# Altium project Main_board2.PrjPcb
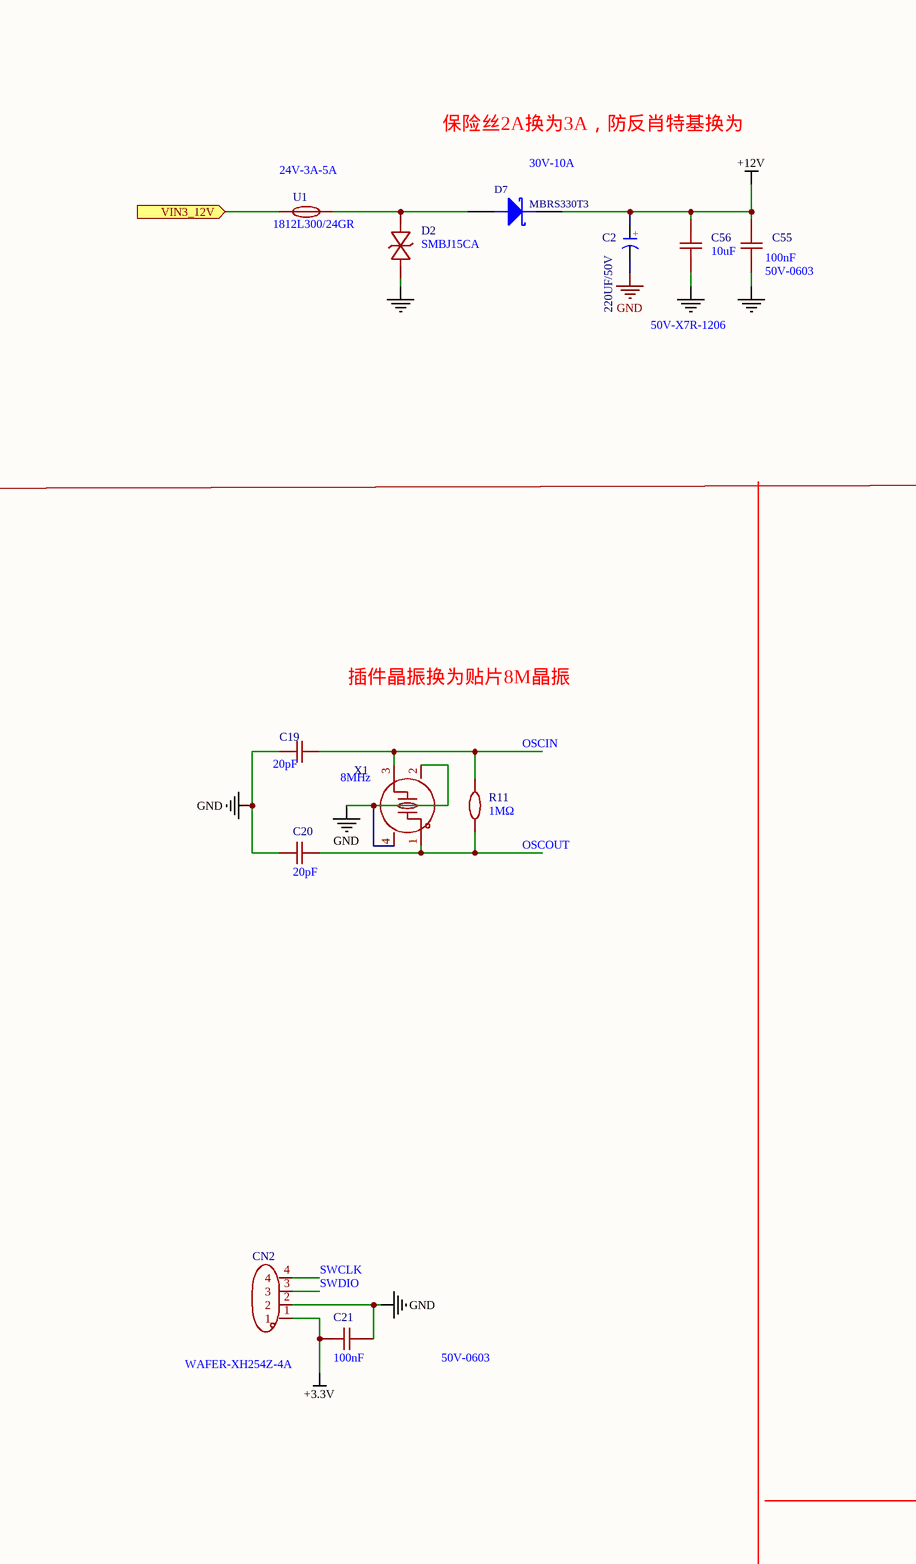
[diagram p0: heater_V1.schdoc, top left]
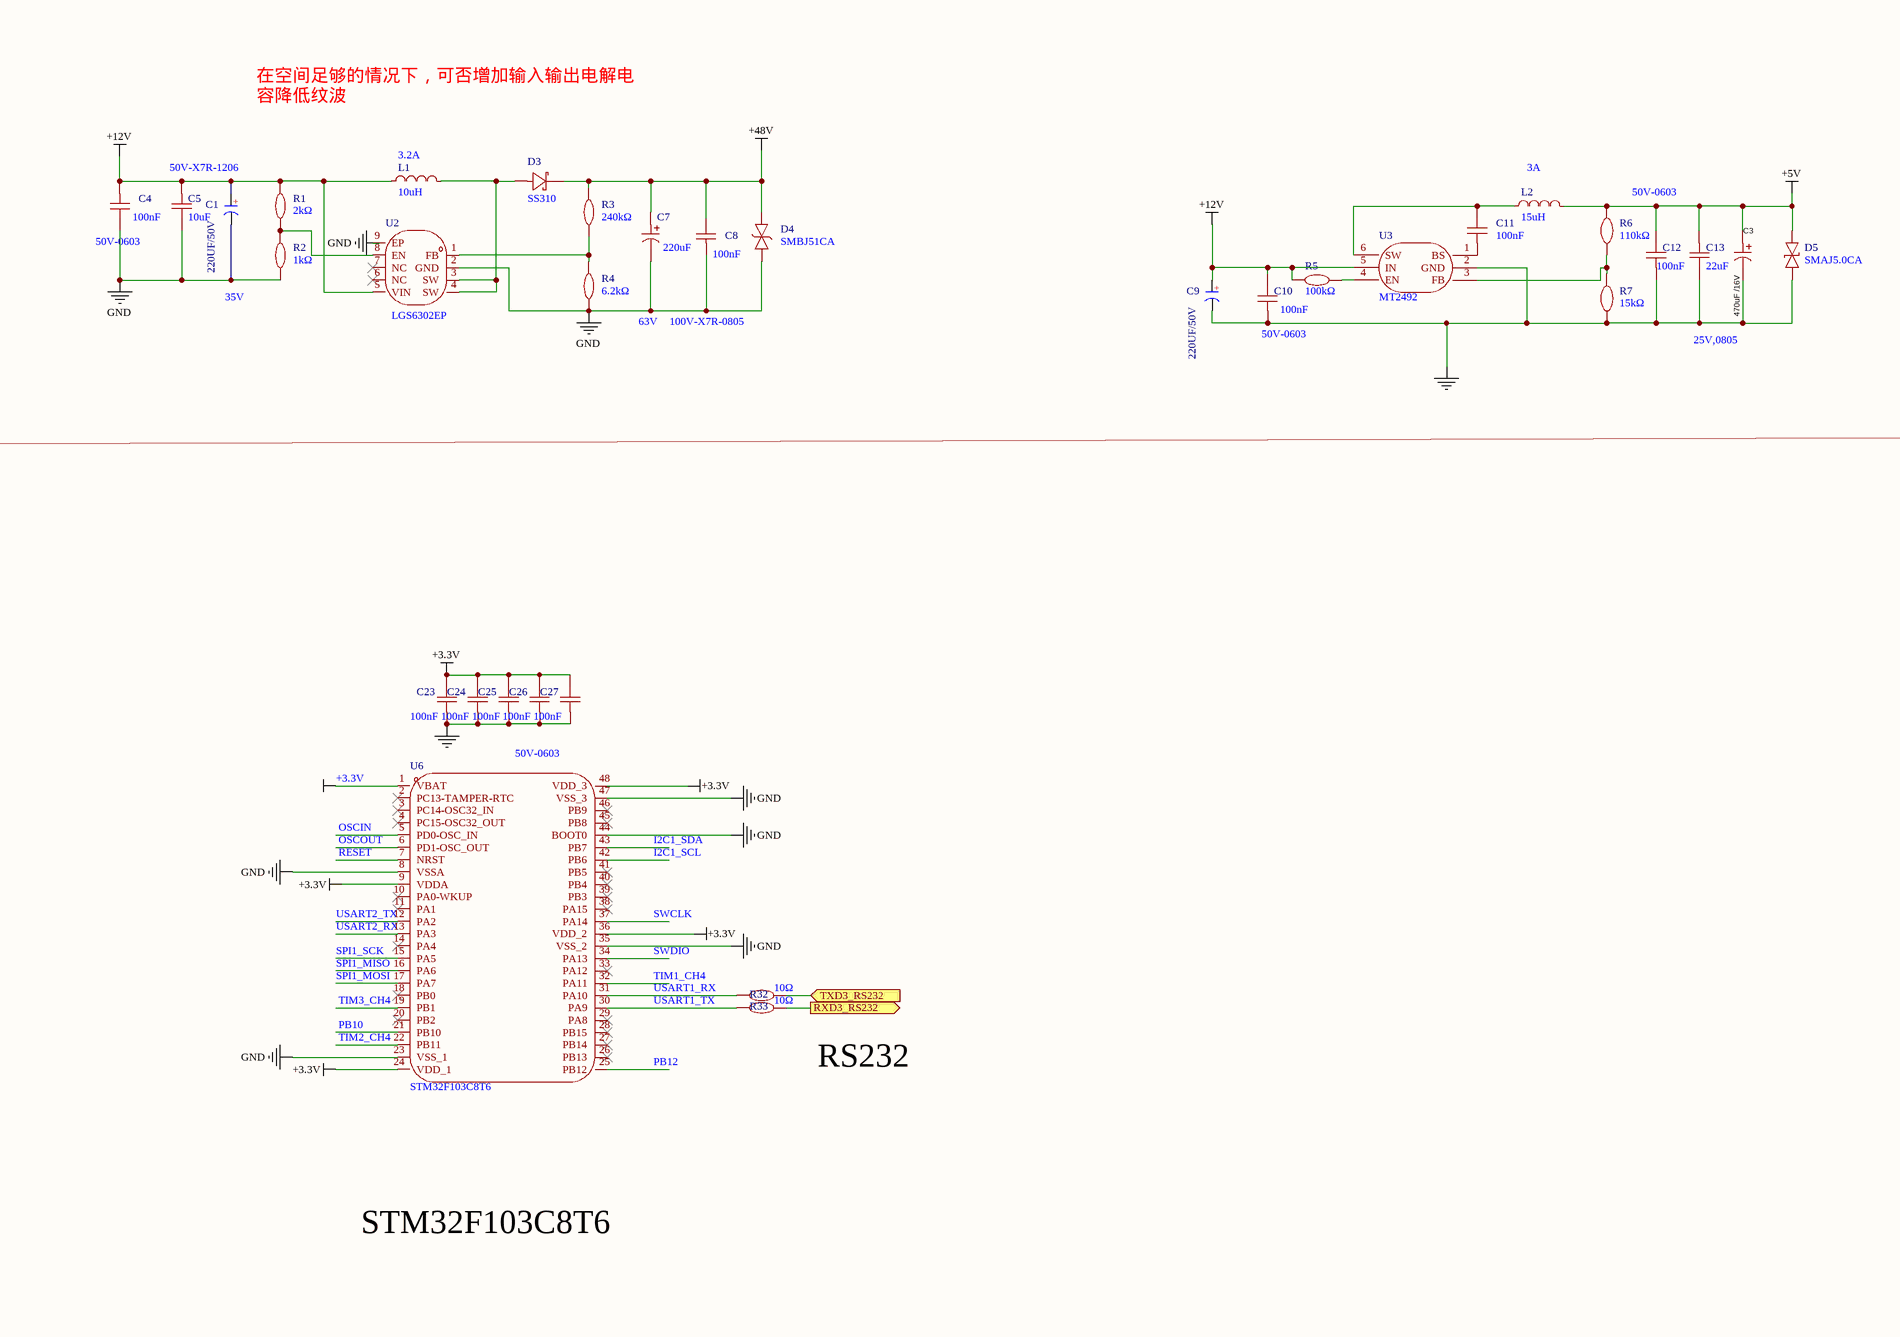
[diagram p1: heater_V1.schdoc, top middle]
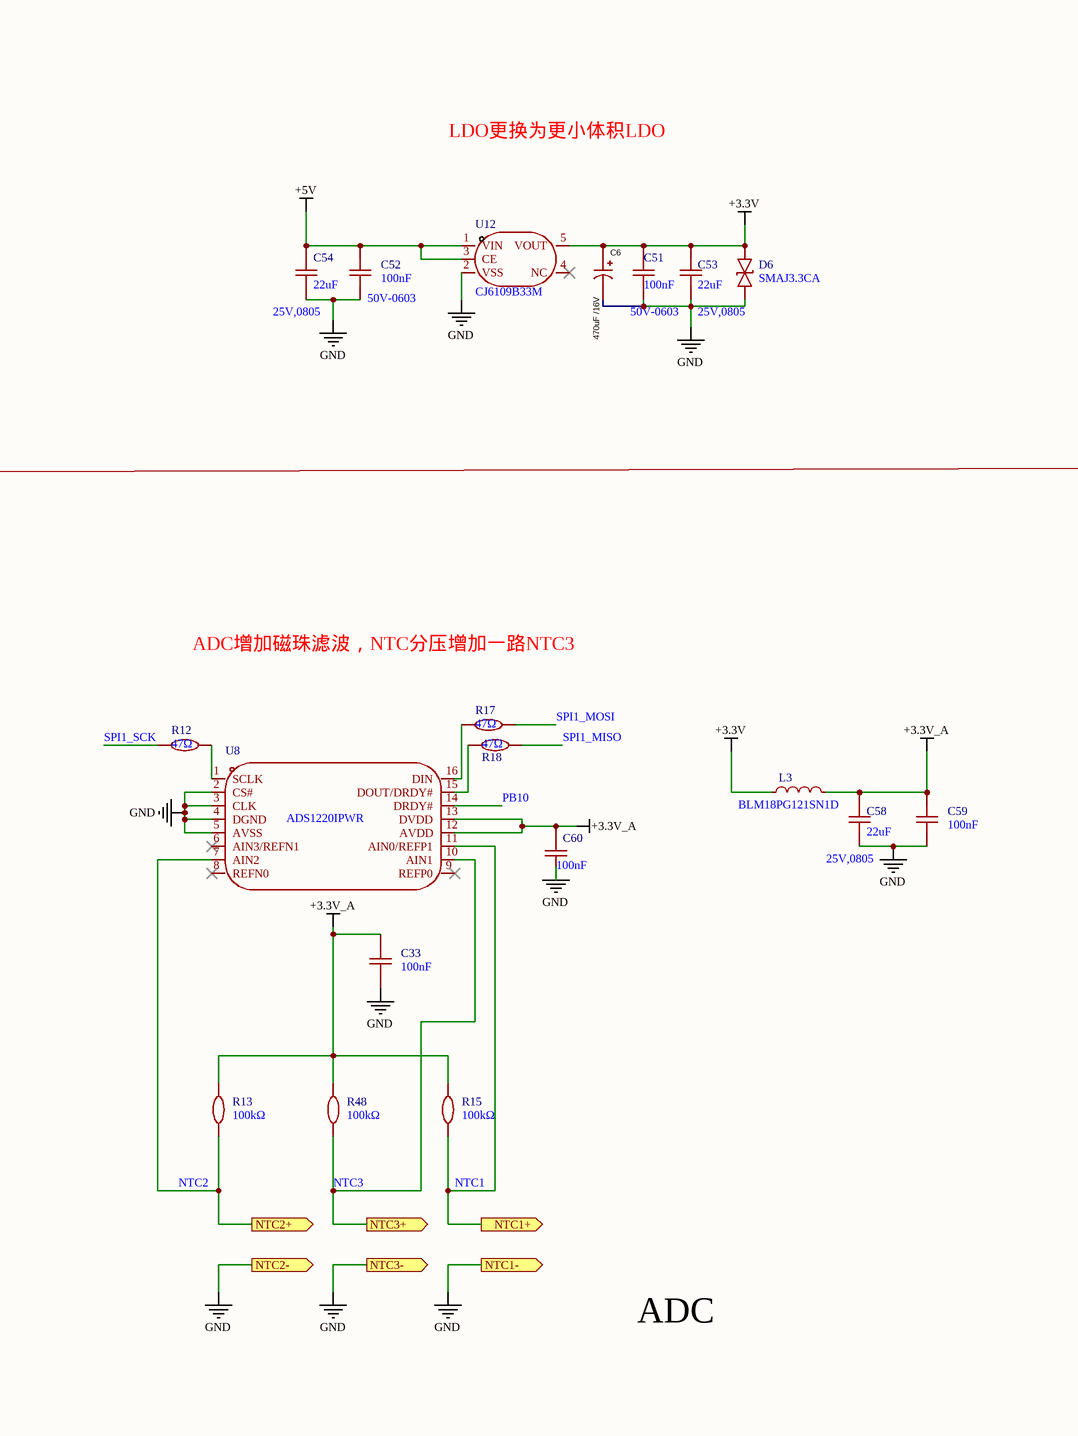
[diagram p2: heater_V1.schdoc, top right]
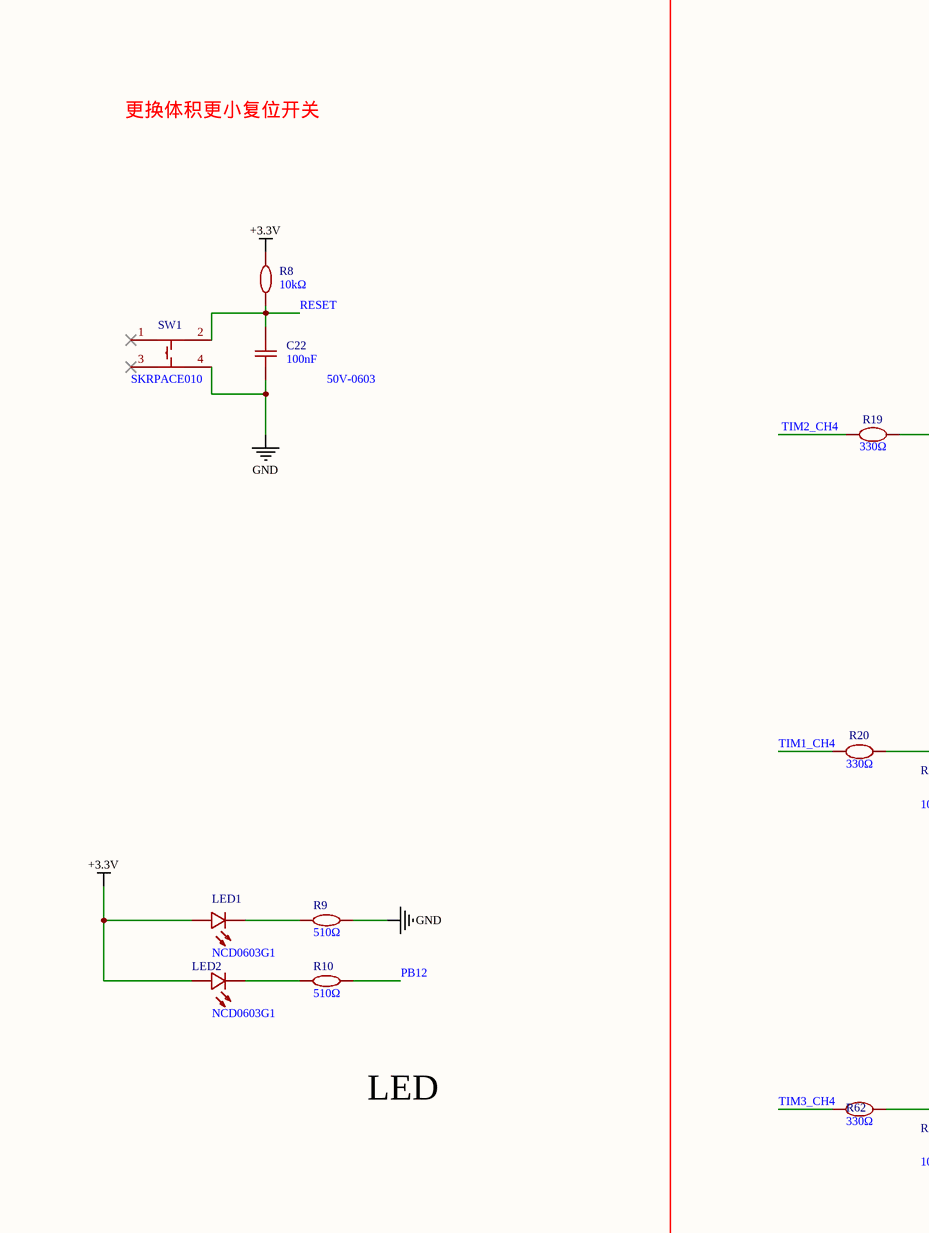
[diagram p3: heater_V1.schdoc, bottom left]
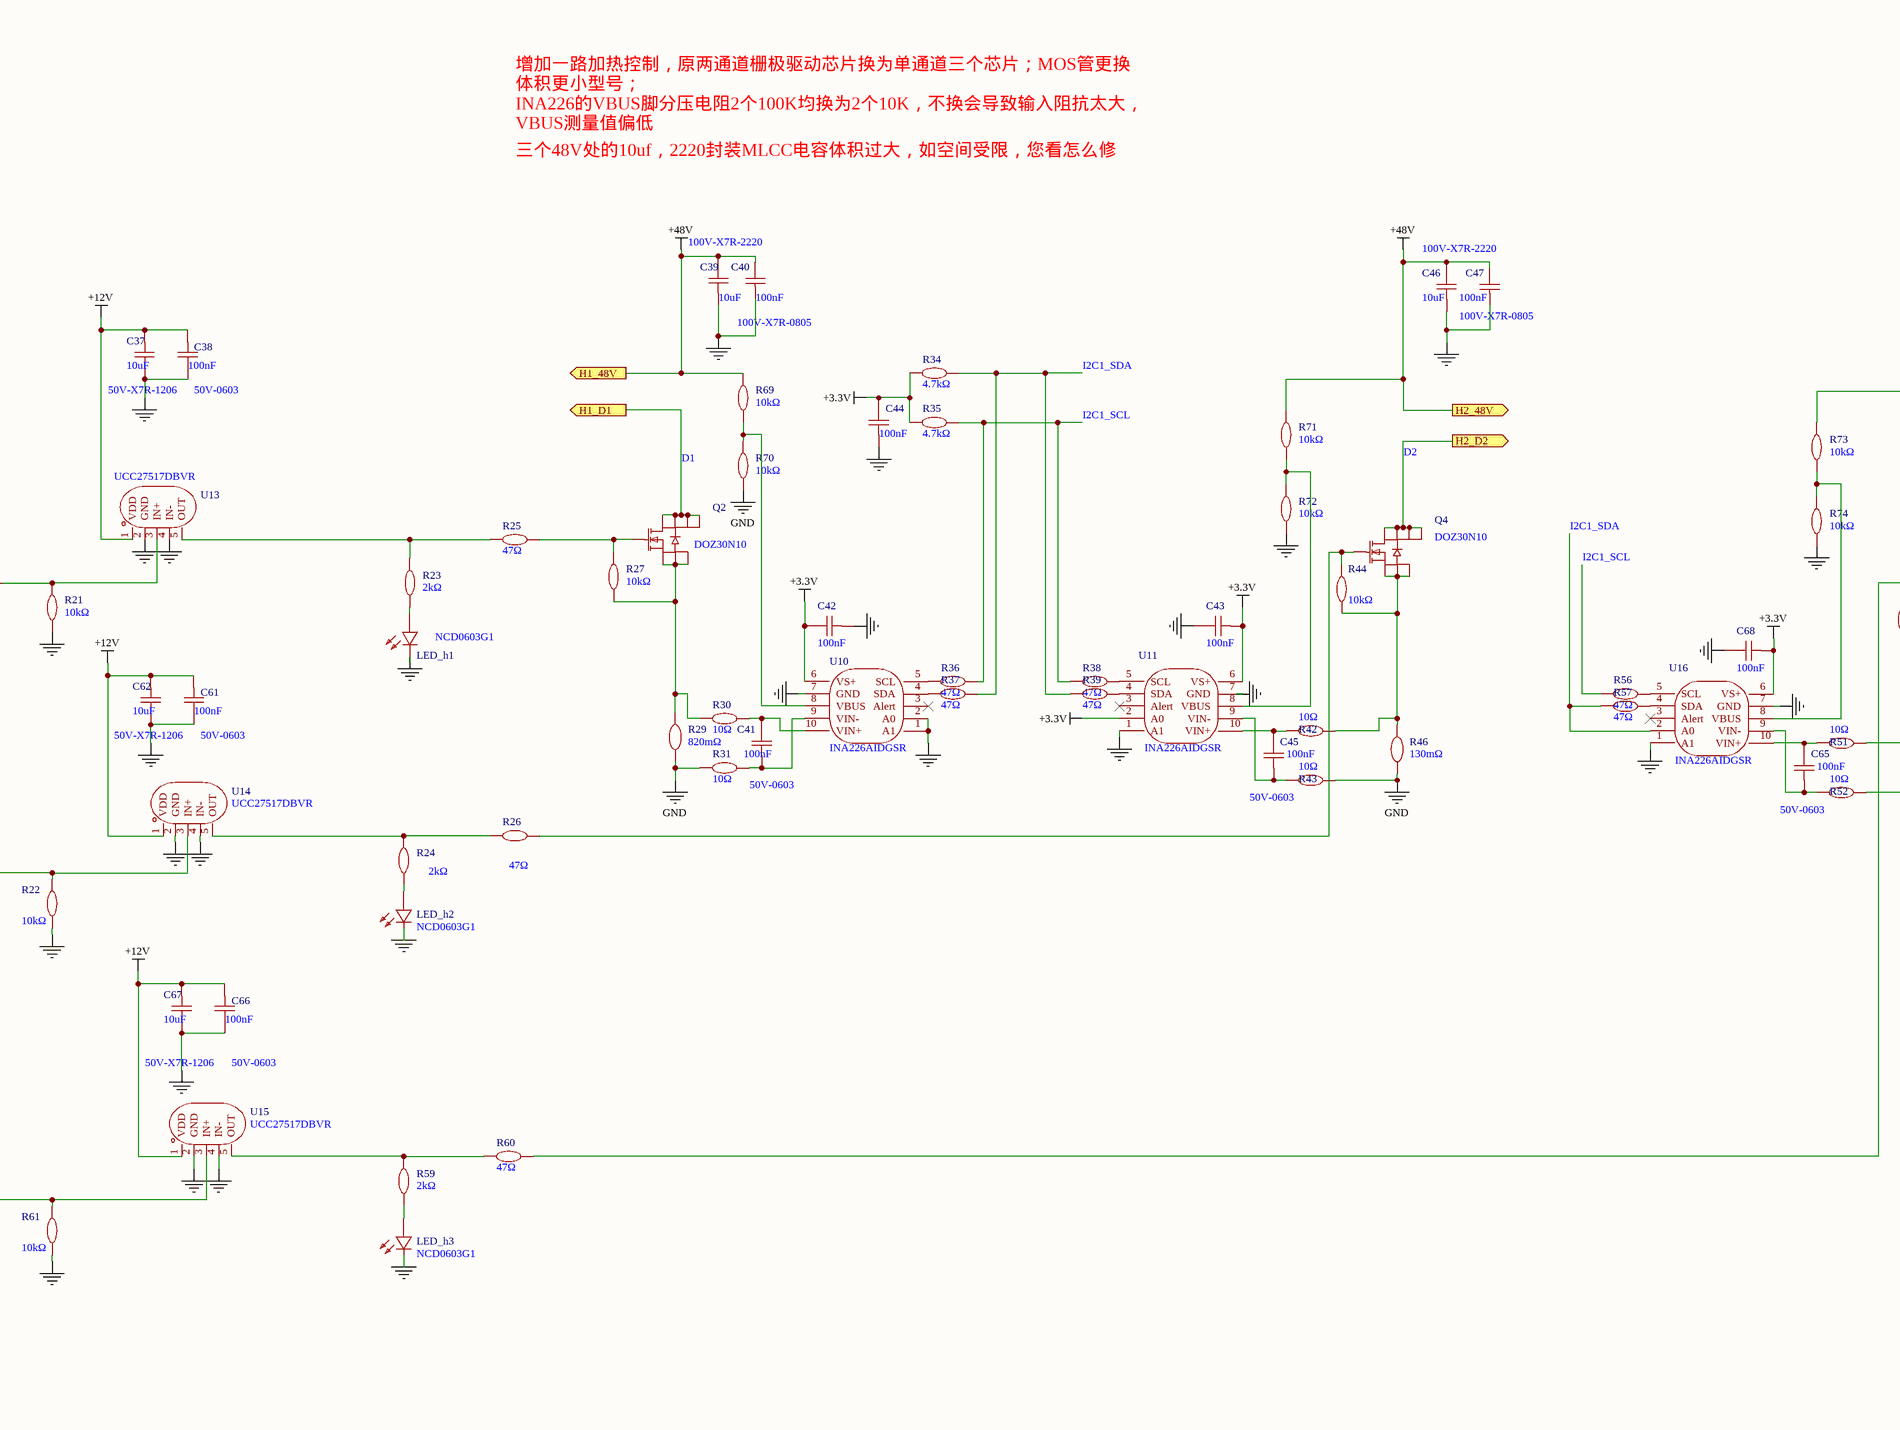
[diagram p4: heater_V1.schdoc, bottom middle]
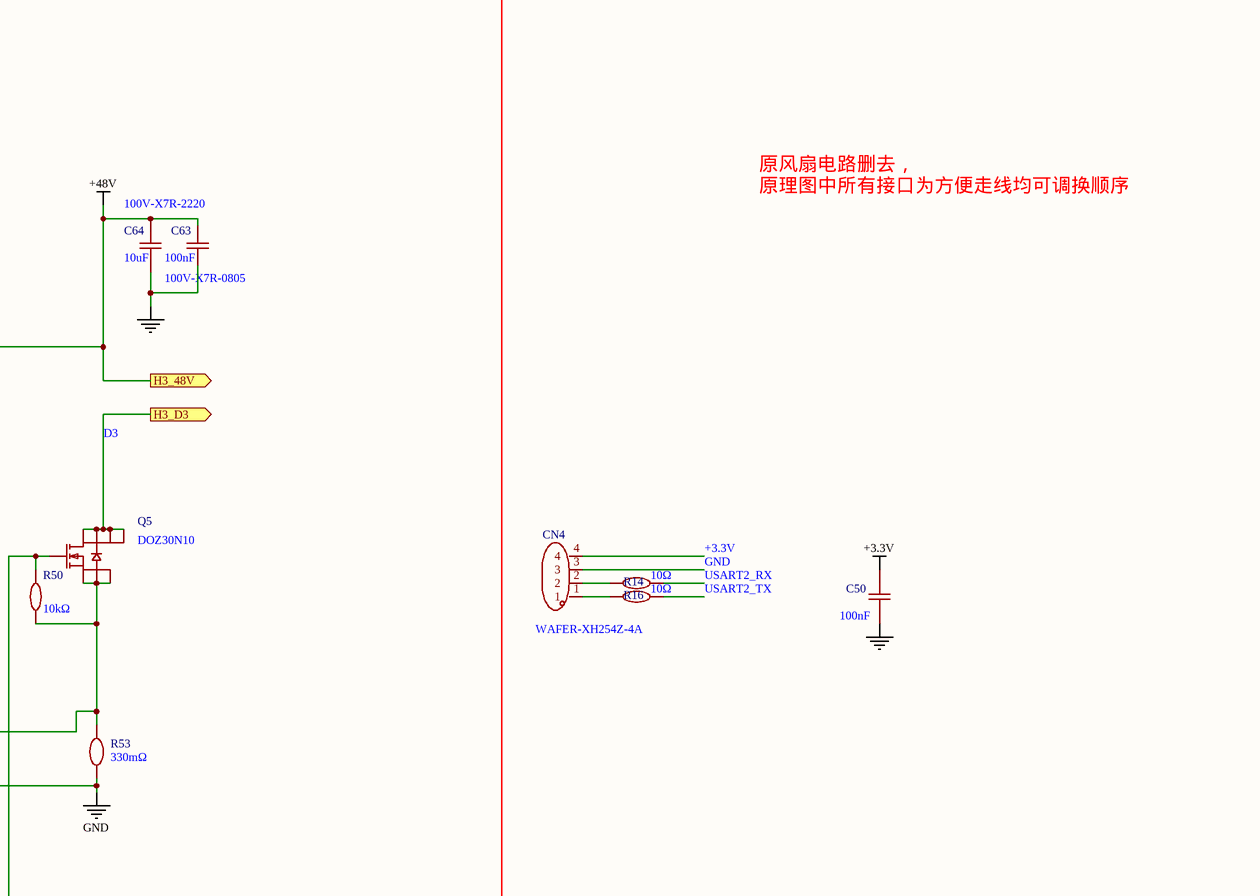
[diagram p5: heater_V1.schdoc, bottom right]
2 sheets, 150 parts. Net scope: flat (ports and power ports of the same name join across sheets).
Board file: BD2_yd_V1.0.PcbDoc
Sheets:
  heater_V1.schdoc
  Connect.SchDoc

## Sheet heater_V1.schdoc
size 848 x 601 mm; Symbol: Sheet-Symbol_A3; Device: Sheet-Symbol_A3; Version: V1.0; Page Size: A3; @Page Count: 1; @Update Date: 2025-12-23; @Create Date: 2025-08-19; @Page No: 1; @Page Name: 1; @Create Time: 06:20:01; @Update Time: 10:57:01; Width: 3304; Height: 2338; Region Start: 1; X Region Count: 6; Y Region Count: 4; Blade Width: 10; Title Block Position: 3

### Parts
C1  220UF/50V  [CAP 5.0*10*12.5]
C2  220UF/50V  [CAP 5.0*10*12.5]
C3  470uF /16V  [CAP-TH_BD8.0-P3.50-D0.6-FD]
C4  100nF  [C0603]
C5  10uF  [C1206]
C6  470uF /16V  [CAP-TH_BD8.0-P3.50-D0.6-FD]
C7  220uF  [CAP-TH_BD10.0-P5.00-D0.6-FD-A]
C8  100nF  [C0805]
C9  220UF/50V  [CAP 5.0*10*12.5]
C10  100nF  [C0603]
C11  100nF  [C0603]
C12  100nF  [C0603]
C13  22uF  [C0805]
C19  20pF  [C0603]
C20  20pF  [C0603]
C21  100nF  [C0603]
C22  100nF  [C0603]
C23  100nF  [C0603]
C24  100nF  [C0603]
C25  100nF  [C0603]
C26  100nF  [C0603]
C27  100nF  [C0603]
C33  100nF  [C0603]
C37  10uF  [C1206]
C38  100nF  [C0603]
C39  10uF  [C2220]
C40  100nF  [C0805]
C41  100nF  [C0603]
C42  100nF  [C0603]
C43  100nF  [C0603]
C44  100nF  [C0603]
C45  100nF  [C0603]
C46  10uF  [C2220]
C47  100nF  [C0805]
C50  100nF  [C0603]
C51  100nF  [C0603]
C52  100nF  [C0603]
C53  22uF  [C0805]
C54  22uF  [C0805]
C55  100nF  [C0603]
C56  10uF  [C1206]
C58  22uF  [C0805]
C59  100nF  [C0603]
C60  100nF  [C0603]
C61  100nF  [C0603]
C62  10uF  [C1206]
C63  100nF  [C0805]
C64  10uF  [C2220]
C65  100nF  [C0603]
C66  100nF  [C0603]
C67  10uF  [C1206]
C68  100nF  [C0603]
CN2  WAFER-XH254Z-4A  [CONN-TH_XH-4A]
CN4  WAFER-XH254Z-4A  [CONN-TH_XH-4A]
D2  SMBJ15CA  [SMB_L4.6-W3.6-LS5.4-BI]
D3  SS310  [SMA_L4.3-W2.6-LS5.0-FD]
D4  SMBJ51CA  [SMB_L4.4-W3.6-LS5.3-BI]
D5  SMAJ5.0CA  [SMA_L4.4-W2.6-LS5.0-BI]
D6  SMAJ3.3CA  [SMA_L4.4-W2.6-LS5.0-BI]
D7  MBRS330T3  [MBRS340]
L1  10uH  [IND-SMD_L5.4-W5.2_FXL0530]
L2  15uH  [IND-SMD_L7.0-W6.6_FXL0630]
L3  BLM18PG121SN1D  [L 0603]
LED1  NCD0603G1  [LED0603-RD_1]
LED2  NCD0603G1  [LED0603-RD_1]
LED_h1  NCD0603G1  [LED0603-RD_1]
LED_h2  NCD0603G1  [LED0603-RD_1]
LED_h3  NCD0603G1  [LED0603-RD_1]
Q2  DOZ30N10  [POWERVDFN-8_L3.2-W3.1-P0.65-LS3.3-BL-1]
Q4  DOZ30N10  [POWERVDFN-8_L3.2-W3.1-P0.65-LS3.3-BL-1]
Q5  DOZ30N10  [POWERVDFN-8_L3.2-W3.1-P0.65-LS3.3-BL-1]
R1  2kΩ  [R0603]
R2  1kΩ  [R0603]
R3  240kΩ  [R0603]
R4  6.2kΩ  [R0603]
R5  100kΩ  [R0603]
R6  110kΩ  [R0603]
R7  15kΩ  [R0603]
R8  10kΩ  [R0603]
R9  510Ω  [R0603]
R10  510Ω  [R0603]
R11  1MΩ  [R0603]
R12  47Ω  [R0603]
R13  100kΩ  [R0603]
R14  10Ω  [R0603]
R15  100kΩ  [R0603]
R16  10Ω  [R0603]
R17  47Ω  [R0603]
R18  47Ω  [R0603]
R19  330Ω  [R0603]
R20  330Ω  [R0603]
R21  10kΩ  [R0603]
R22  10kΩ  [R0603]
R23  2kΩ  [R0603]
R24  2kΩ  [R0603]
R25  47Ω  [R0603]
R26  47Ω  [R0603]
R27  10kΩ  [R0603]
R29  820mΩ  [RES-SMD_L6.4-W3.2-1]
R30  10Ω  [R0603]
R31  10Ω  [R0603]
R32  10Ω  [R0603]
R33  10Ω  [R0603]
R34  4.7kΩ  [R0603]
R35  4.7kΩ  [R0603]
R36  47Ω  [R0603]
R37  47Ω  [R0603]
R38  47Ω  [R0603]
R39  47Ω  [R0603]
R42  10Ω  [R0603]
R43  10Ω  [R0603]
R44  10kΩ  [R0603]
R46  130mΩ  [RES-SMD_L6.4-W3.2-R2512]
R48  100kΩ  [R0603]
R50  10kΩ  [R0603]
R51  10Ω  [R0603]
R52  10Ω  [R0603]
R53  330mΩ  [RES-SMD_L6.4-W3.2-R2512]
R56  47Ω  [R0603]
R57  47Ω  [R0603]
R59  2kΩ  [R0603]
R60  47Ω  [R0603]
R61  10kΩ  [R0603]
R62  330Ω  [R0603]
R69  10kΩ  [R0603]
R70  10kΩ  [R0603]
R71  10kΩ  [R0603]
R72  10kΩ  [R0603]
R73  10kΩ  [R0603]
R74  10kΩ  [R0603]
SW1  SKRPACE010  [KEY-SMD_4P-L4.2-W3.2-P2.20-LS4.6]
U1  1812L300/24GR  [F1812]
U2  LGS6302EP  [ESOP-8_L4.9-W3.9-P1.27-LS6.0-BL-EP-4]
U3  MT2492  [SOT-23-6_L2.9-W1.6-P0.95-LS2.8-BL_3]
U6  STM32F103C8T6  [LQFP-48_L7.0-W7.0-P0.50-LS9.0-BL]
U8  ADS1220IPWR  [TSSOP-16_L5.0-W4.4-P0.65-LS6.4-BL]
U10  INA226AIDGSR  [MSOP-10_L3.0-W3.0-P0.50-LS5.0-BL]
U11  INA226AIDGSR  [MSOP-10_L3.0-W3.0-P0.50-LS5.0-BL]
U12  CJ6109B33M  [SOT-23-5_L2.9-W1.6-P0.95-LS2.8-BR]
U13  UCC27517DBVR  [SOT-23-5_L3.0-W1.7-P0.95-LS2.8-BR]
U14  UCC27517DBVR  [SOT-23-5_L3.0-W1.7-P0.95-LS2.8-BR]
U15  UCC27517DBVR  [SOT-23-5_L3.0-W1.7-P0.95-LS2.8-BR]
U16  INA226AIDGSR  [MSOP-10_L3.0-W3.0-P0.50-LS5.0-BL]
X1  8MHz  [CRYSTAL-SMD_4P-L3.2-W2.5-BL]

### Ports
H1_48V (out), H1_D1 (out), H2_48V (out), H2_D2 (out), H3_48V (out), H3_D3 (out), NTC1+ (out), NTC1- (out), NTC2+ (out), NTC2- (out), NTC3+ (out), NTC3- (out), RXD3_RS232 (out), TXD3_RS232 (in), VIN3_12V (in)

### Nets
+3.3V: C6.1 C21.2 C23.1 C24.1 C25.1 C26.1 C27.1 C42.1 C43.2 C44.1 C50.1 C51.1 C53.2 C68.2 CN2.1 CN4.4 D6.2 L3.1 LED1.2(A) LED2.2(A) R8.2 R34.1 R35.1 U6.1(VBAT) U6.9(VDDA) U6.24(VDD_1) U6.36(VDD_2) U6.48(VDD_3) U10.6(VS+) U11.2(A0) U11.6(VS+) U12.5(VOUT) U16.6(VS+)
+3.3V_A: C33.2 C58.2 C59.1 C60.1 L3.2 R13.2 R15.2 R48.2 U8.12(AVDD) U8.13(DVDD)
+5V: C3.1 C12.1 C13.2 C52.1 C54.2 D5.2 L2.1 R6.2 U12.1(VIN) U12.3(CE)
+12V: C1.1 C2.1 C4.2 C5.2 C9.1 C10.1 C37.2 C38.2 C55.2 C56.2 C61.2 C62.2 C66.2 C67.2 D7.2(K) L1.2 R1.2 R5.2 U2.5(VIN) U3.5(IN) U13.1(VDD) U14.1(VDD) U15.1(VDD)
+48V: C7.1 C8.2 C39.1 C40.2 C46.1 C47.2 C63.2 C64.1 D3.2(K) D4.2 R3.2 R69.2 R71.2 R73.2 ; port H1_48V, port H2_48V, port H3_48V
GND: C1.2 C2.2 C3.2 C4.1 C5.1 C6.2 C7.2 C8.1 C9.2 C10.2 C12.2 C13.1 C19.1 C20.1 C21.1 C22.2 C23.2 C24.2 C25.2 C26.2 C27.2 C33.1 C37.1 C38.1 C39.2 C40.1 C42.2 C43.1 C44.2 C46.2 C47.1 C50.2 C51.2 C52.2 C53.1 C54.1 C55.1 C56.1 C58.1 C59.2 C60.2 C61.1 C62.1 C63.1 C64.2 C66.1 C67.1 C68.1 CN2.2 CN4.3 D2.1 D4.1 D5.1 D6.1 LED_h1.1(K) LED_h2.1(K) LED_h3.1(K) R2.1 R4.1 R7.1 R9.2 R21.1 R22.1 R29.1 R31.1 R43.2 R46.1 R52.2 R53.1 R61.1 R70.1 R72.1 R74.1 SW1.4 U2.2(GND) U2.9(EP) U3.2(GND) U6.8(VSSA) U6.23(VSS_1) U6.35(VSS_2) U6.44(BOOT0) U6.47(VSS_3) U8.2(CS#) U8.3(CLK) U8.4(DGND) U8.5(AVSS) U10.1(A1) U10.2(A0) U10.7(GND) U11.1(A1) U11.7(GND) U12.2(VSS) U13.2(GND) U13.4(IN-) U14.2(GND) U14.4(IN-) U15.2(GND) U15.4(IN-) U16.1(A1) U16.7(GND) X1.2(GND) X1.4(GND) ; port NTC1-, port NTC2-, port NTC3-
D1: Q2.5(D) Q2.6(D) Q2.7(D) Q2.8(D) ; port H1_D1
D2: Q4.5(D) Q4.6(D) Q4.7(D) Q4.8(D) ; port H2_D2
D3: Q5.5(D) Q5.6(D) Q5.7(D) Q5.8(D) ; port H3_D3
I2C1_SCL: R35.2 R36.2 R38.1 R56.1 U6.42(PB6)
I2C1_SDA: R34.2 R37.2 R39.1 R57.1 U6.43(PB7) U16.2(A0)
NTC1: R15.1 U8.11(AIN0/REFP1) ; port NTC1+
NTC2: R13.1 U8.7(AIN2) ; port NTC2+
NTC3: R48.1 U8.10(AIN1) ; port NTC3+
OSCIN: C19.2 R11.2 U6.5(PD0-OSC_IN) X1.3
OSCOUT: C20.2 R11.1 U6.6(PD1-OSC_OUT) X1.1
PB10: U6.21(PB10) U8.14(DRDY#)
PB12: R10.2 U6.25(PB12)
RESET: C22.1 R8.1 SW1.2 U6.7(NRST)
SPI1_MISO: R18.2 U6.16(PA6)
SPI1_MOSI: R17.2 U6.17(PA7)
SPI1_SCK: R12.1 U6.15(PA5)
SWCLK: CN2.4 U6.37(PA14)
SWDIO: CN2.3 U6.34(PA13)
TIM1_CH4: R20.1 U6.32(PA11)
TIM2_CH4: R19.1 U6.22(PB11)
TIM3_CH4: R62.1 U6.19(PB1)
USART1_RX: R32.2 U6.31(PA10)
USART1_TX: R33.2 U6.30(PA9)
USART2_RX: R14.1 U6.13(PA3)
USART2_TX: R16.1 U6.12(PA2)
NetC11_1: C11.1 L2.2 U3.6(SW)
NetC11_2: C11.2 U3.1(BS)
NetC41_1: C41.1 R30.2 U10.10(VIN+)
NetC41_2: C41.2 R31.2 U10.9(VIN-)
NetC45_1: C45.1 R42.1 U11.10(VIN+)
NetC45_2: C45.2 R43.1 U11.9(VIN-)
NetC65_1: C65.1 R51.1 U16.10(VIN+)
NetC65_2: C65.2 R52.1 U16.9(VIN-)
NetCN4_1: CN4.1 R16.2
NetCN4_2: CN4.2 R14.2
NetD2_2: D2.2 D7.1(A) U1.2
NetD3_1: D3.1(A) L1.1 U2.3(SW) U2.4(SW)
NetLED1_1: LED1.1(K) R9.1
NetLED2_1: LED2.1(K) R10.1
NetLED_h1_2: LED_h1.2(A) R23.1
NetLED_h2_2: LED_h2.2(A) R24.1
NetLED_h3_2: LED_h3.2(A) R59.1
NetP11_9: R32.1 ; port TXD3_RS232
NetP11_11: R33.1 ; port RXD3_RS232
NetP20_11: U1.1 ; port VIN3_12V
NetQ2_1: Q2.1(S) Q2.2(S) Q2.3(S) R27.1 R29.2 R30.1
NetQ2_4: Q2.4(G) R25.2 R27.2
NetQ4_1: Q4.1(S) Q4.2(S) Q4.3(S) R42.2 R44.1 R46.2
NetQ4_4: Q4.4(G) R26.2 R44.2
NetQ5_1: Q5.1(S) Q5.2(S) Q5.3(S) R50.1 R51.2 R53.2
NetQ5_4: Q5.4(G) R50.2 R60.2
NetR1_1: R1.1 R2.2 U2.8(EN)
NetR3_1: R3.1 R4.2 U2.1(FB)
NetR5_1: R5.1 U3.4(EN)
NetR6_1: R6.1 R7.2 U3.3(FB)
NetR12_2: R12.2 U8.1(SCLK)
NetR17_1: R17.1 U8.16(DIN)
NetR18_1: R18.1 U8.15(DOUT/DRDY#)
NetR19_2: R19.2 R21.2 U13.3(IN+)
NetR20_2: R20.2 R22.2 U14.3(IN+)
NetR23_2: R23.2 R25.1 U13.5(OUT)
NetR24_2: R24.2 R26.1 U14.5(OUT)
NetR36_1: R36.1 U10.5(SCL)
NetR37_1: R37.1 U10.4(SDA)
NetR38_2: R38.2 U11.5(SCL)
NetR39_2: R39.2 U11.4(SDA)
NetR56_2: R56.2 U16.5(SCL)
NetR57_2: R57.2 U16.4(SDA)
NetR59_2: R59.2 R60.1 U15.5(OUT)
NetR61_2: R61.2 R62.2 U15.3(IN+)
NetR69_1: R69.1 R70.2 U10.8(VBUS)
NetR71_1: R71.1 R72.2 U11.8(VBUS)
NetR73_1: R73.1 R74.2 U16.8(VBUS)

Not connected (* = marked no-connect by the designer): SW1 1* 3*; U2 6(NC)* 7(NC)*; U6 2(PC13-TAMPER-RTC)* 3(PC14-OSC32_IN)* 4(PC15-OSC32_OUT)* 10(PA0-WKUP)* 11(PA1)* 14(PA4)* 18(PB0)* 20(PB2)* 26(PB13)* 27(PB14)* 28(PB15)* 29(PA8)* 33(PA12)* 38(PA15)* 39(PB3)* 40(PB4)* 41(PB5)* 45(PB8)* 46(PB9)*; U8 6(AIN3/REFN1)* 8(REFN0)* 9(REFP0)*; U10 3(Alert)*; U11 3(Alert)*; U12 4(NC)*; U16 3(Alert)*

### Notes on the sheet
- (near U1) 24V-3A-5A
- 保险丝2A换为3A，防反肖特基换为PMOS
- (near D7) 30V-10A
- 在空间足够的情况下，可否增加输入输出电解电容降低纹波
- (near L1) 3.2A
- LDO更换为更小体积LDO
- 50V-X7R-1206
- (near L2) 3A
- 50V-0603
- (near C55) 50V-0603
- (near C4) 50V-0603
- (near C52) 50V-0603
- (near R2) 35V
- 63V
- 100V-X7R-0805
- (near C10) 50V-0603
- 25V,0805
- (near C54) 25V,0805
- 插件晶振换为贴片8M晶振
- ADC增加磁珠滤波，NTC分压增加一路NTC3
- (near C58) 25V,0805
- RS232
- STM32F103C8T6
- ADC
- 增加一路加热控制，原两通道栅极驱动芯片换为单通道三个芯片；MOS管更换体积更小型号；
  INA226的VBUS脚分压电阻2个100K均换为2个10K，不换会导致输入阻抗太大，VBUS测量值偏低
- 三个48V处的10uf，2220封装MLCC电容体积过大，如空间受限，您看怎么修改
- 100V-X7R-2220
- 更换体积更小复位开关
- 原风扇电路删去，
  原理图中所有接口为方便走线均可调换顺序
- (near C38) 50V-0603
- (near C61) 50V-0603
- (near R43) 50V-0603
- (near R52) 50V-0603
- (near C66) 50V-0603
- LED
- 1
- 2
- 3
- 4
- 5
- 6
- A
- B
- C
- D
- 2025-12-23
- 2025-08-19
- V1.0
- A3
- (in symbol C-CAP) +

### Library data of the parts
C1 C2 C9 = C-CAP: 直插电解电容; 版权归属: 源创客; BOM名称: 直插电解电容; 学习资源: www.ooocke.com
C3 C6 = JBLE2471M016D090RLM 470UF 16V: Add into BOM: yes; Rated Voltage: 16V; Ripple Current: 3.7A@100kHz; Symbol: JBLE2471M016D090RLM 470UF 16V; Device: JBLE2471M016D090RLM 470UF 16V; Supplier Part: C19270650; Manufacturer Part: JBLE2471M016D090RLM 470UF 16V; JLCPCB Part Class: Extended Part; Datasheet: https://atta.szlcsc.com/upload/public/pdf/source/20240115/1E5B34C3EFC94403EAAAB66897201DA6.pdf; Supplier: LCSC; Convert to PCB: yes; Value: 470uF
C4 C10-C12 C21-C27 C33 C38 C41-C45 C50-C52 C55 C59-C61 C65 C66 C68 = CGA0603X7R104K500JT: Add into BOM: yes; Voltage Rated: 50V; Temperature Coefficient: X7R; Symbol: CGA0603X7R104K500JT; Device: CGA0603X7R104K500JT; Supplier Part: C6119867; Manufacturer Part: CGA0603X7R104K500JT; Supplier Footprint: 0603; Supplier: LCSC; Convert to PCB: yes; Value: 100nF
C5 C37 C56 C62 C67 = CL31B106KBHNNNE: Add into BOM: yes; Voltage Rated: 50V; Temperature Coefficient: X7R; Symbol: CL31B106KBHNNNE; Device: CL31B106KBHNNNE; Supplier Part: C89632; Manufacturer Part: CL31B106KBHNNNE; Supplier Footprint: 1206; Datasheet: https://atta.szlcsc.com/upload/public/pdf/source/20161130/1480498807789.pdf; Supplier: LCSC; Convert to PCB: yes; Value: 10uF
C7 = 2210631013R00: Add into BOM: yes; Voltage Rating: 63V; Symbol: 2210631013R00; Device: 2210631013R00; Supplier Part: C5455531; Manufacturer Part: 2210631013R00; Datasheet: https://atta.szlcsc.com/upload/public/pdf/source/20230512/7B1C8A29FA1E3496887FAF2429022B87.pdf; Supplier: LCSC; Convert to PCB: yes; Value: 220uF; Ripple Current: -; Equivalent Series Resistance(ESR): -; Type: -; Pin Spacing: -; Diameter: 10mm; Height - Seated (Max): 13mm; Lifetime: -
C8 C40 C47 C63 = CL21B104KCFNNNE: Add into BOM: yes; Voltage Rated: 100V; Temperature Coefficient: X7R; Symbol: CL21B104KCFNNNE; Device: CL21B104KCFNNNE; Supplier Part: C28233; Manufacturer Part: CL21B104KCFNNNE; Supplier Footprint: 0805; Datasheet: https://atta.szlcsc.com/upload/public/pdf/source/20160218/1457707763339.pdf; Supplier: LCSC; Convert to PCB: yes; Value: 100nF
C13 C53 C54 C58 = FCC0805X226M250FT: Add into BOM: yes; Voltage Rating: 25V; Temperature Coefficient: X5R; Symbol: FCC0805X226M250FT; Device: FCC0805X226M250FT; Supplier Part: C7419435; Manufacturer Part: FCC0805X226M250FT; Supplier Footprint: 0805; Datasheet: https://atta.szlcsc.com/upload/public/pdf/source/20230926/96CBFEAC228090559554C216363F8731.pdf; Supplier: LCSC; Convert to PCB: yes; Value: 22uF
C19 C20 = CL10C200JB8NNNC: Add into BOM: yes; Voltage Rated: 50V; Temperature Coefficient: C0G; Symbol: CL10C200JB8NNNC; Device: CL10C200JB8NNNC; Supplier Part: C1648; Manufacturer Part: CL10C200JB8NNNC; Supplier Footprint: 0603; Datasheet: https://atta.szlcsc.com/upload/public/pdf/source/20160218/1457707763339.pdf; Supplier: LCSC; Convert to PCB: yes; Value: 20pF
C39 C46 C64 = FS55X106K101EGG: Add into BOM: yes; Voltage Rating: 100V; Temperature Coefficient: X7R; Symbol: FS55X106K101EGG; Device: FS55X106K101EGG; Supplier Part: C2843466; Manufacturer Part: FS55X106K101EGG; Supplier Footprint: 2220; Datasheet: https://atta.szlcsc.com/upload/public/pdf/source/20210709/C2843466_BD04F5BE51854FBFAEF543369FEFD899.pdf; Supplier: LCSC; Convert to PCB: yes; Value: 10uF
CN2 CN4 = WAFER-XH254Z-4A: Add into BOM: yes; Pins Structure: 1x4P; Pitch: 2.54mm; Reference Series: XH; Number of PINs Per Row: 4; Current Rating: 3A; Voltage Rating: 250V; Plastic Material: PA66; Flame Retardant Rating: UL94V-0; Symbol: WAFER-XH254Z-4A; Device: WAFER-XH254Z-4A; Supplier Part: C7432684; Manufacturer Part: WAFER-XH254Z-4A; Datasheet: https://atta.szlcsc.com/upload/public/pdf/source/20230718/3B4FABA5D38EFB02DAF74E7C2B33D98F.pdf; Supplier: LCSC; Convert to PCB: yes; Number of Pins: 4P; Number of Rows: 1
D2 = SMBJ15CA_C19077570: Add into BOM: yes; Reverse Stand-Off Voltage (Vrwm): 15V; Clamping Voltage: 24.4V; Peak Pulse Current (Ipp): 24.59A@10/1000us; Peak Pulse Power Dissipation (Ppp): 600W@10/1000us; Voltage - Breakdown: 18.5V; Reverse Leakage Current (Ir): 5uA; Type: TVS; level of protection: IEC 61000-4-2; Symbol: SMBJ15CA_C19077570; Device: SMBJ15CA_C19077570; Supplier Part: C19077570; Manufacturer Part: SMBJ15CA; Supplier Footprint: DO-214AA(SMB); JLCPCB Part Class: Extended Part; Datasheet: https://item.szlcsc.com/datasheet/SMBJ15CA/20275655.html; Supplier: LCSC; Convert to PCB: yes
D3 = SS310_C7420364: Add into BOM: yes; Forward Voltage (Vf@If): 850mV@3A; Reverse Voltage (Vr): 100V; Rectified Current: 3A; Reverse Leakage Current (Ir): 50uA@100V; Non-Repetitive Peak Forward Surge Current: 80A; Symbol: SS310_C7420364; Device: SS310_C7420364; Supplier Part: C7420364; Manufacturer Part: SS310; Supplier Footprint: SMA(DO-214AC); JLCPCB Part Class: Extended Part; Datasheet: https://item.szlcsc.com/datasheet/SS310/8397186.html; Supplier: LCSC; Convert to PCB: yes; Voltage - Forward(Vf@If): 850mV@3A; Voltage - DC Reverse(Vr): 100V; Current - Rectified: 3A
D4 = SMBJ51CA_C41376101: Add into BOM: yes; Reverse Stand-Off Voltage (Vrwm): 51V; Maximum Clamping Voltage: 82.4V; Peak Pulse Current (Ipp): 7.28A; Peak Pulse Power Dissipation (Ppp): 600W; Breakdown Voltage: 62.7V; Reverse Leakage Current (Ir): 5uA; Type: TVS; level of protection: IEC 61000-4-2; Symbol: SMBJ51CA_C41376101; Device: SMBJ51CA_C41376101; Supplier Part: C41376101; Manufacturer Part: SMBJ51CA; Supplier Footprint: DO-214AA(SMB); JLCPCB Part Class: Extended Part; Datasheet: https://item.szlcsc.com/datasheet/SMBJ51CA/43144818.html; Supplier: LCSC; Convert to PCB: yes; Clamping Voltage: 82.4V; Voltage - Breakdown: 62.7V
D5 = SMAJ5.0CA_C83324: Symbol: SMAJ5.0CA-C83324; Add into BOM: yes; Reverse Stand-Off Voltage (Vrwm): 5V; Maximum Clamping Voltage: 9.2V; Peak Pulse Current (Ipp)@10/1000us: 43.5A; Peak Pulse Power Dissipation (Ppp)@10/1000us: 400W; Breakdown Voltage: 6.4V; Type: TVS; Device: SMAJ5.0CA_C83324; Supplier Part: C83324; Manufacturer Part: SMAJ5.0CA; Supplier Footprint: SMA(DO-214AC); Datasheet: https://atta.szlcsc.com/upload/public/pdf/source/20190402/C374025_5ACE77BC72947DF13CF0CBC7F8B57228.pdf; Supplier: LCSC; Convert to PCB: yes
D6 = SMAJ3.3CA_C2959732: Add into BOM: yes; Reverse Stand-Off Voltage (Vrwm): 3.3V; Maximum Clamping Voltage: 7.3V; Peak Pulse Current (Ipp)@10/1000us: 54.8A; Breakdown Voltage: 4.3V; Reverse Leakage Current (Ir): 200uA; Type: TVS; Symbol: SMAJ3.3CA_C2959732; Device: SMAJ3.3CA_C2959732; Supplier Part: C2959732; Manufacturer Part: SMAJ3.3CA; Supplier Footprint: DO-214AC(SMA); Datasheet: https://atta.szlcsc.com/upload/public/pdf/source/20240321/7565B800065238EC693350450D0B602E.pdf; Supplier: LCSC; Convert to PCB: yes
D7 = DIODE SCHOTTKY: Schottky Diode
L1 = FXL0530-100-M: Add into BOM: yes; Rated Current: 3.2A; Saturation Current (Isat): 3.5A; Symbol: FXL0530-100-M; Device: FXL0530-100-M; Supplier Part: C177248; Manufacturer Part: FXL0530-100-M; Supplier Footprint: SMD,5.2x5.4mm; Datasheet: https://atta.szlcsc.com/upload/public/pdf/source/20240426/3189EA8206330E2108542F9E34E540E7.pdf; Supplier: LCSC; Convert to PCB: yes; Value: 10uH
L2 = FXL0630-150-M: Add into BOM: yes; Rated Current: 3A; Saturation Current (Isat): 4.5A; Symbol: FXL0630-150-M; Device: FXL0630-150-M; Supplier Part: C177243; Manufacturer Part: FXL0630-150-M; Supplier Footprint: SMD,6.6x7mm; Datasheet: https://atta.szlcsc.com/upload/public/pdf/source/20240426/3189EA8206330E2108542F9E34E540E7.pdf; Supplier: LCSC; Convert to PCB: yes; Value: 15uH
L3 = BLM18PG121SN1D: Symbol: BLM18PG121SN1D_C14709; Add into BOM: yes; Current Rating: 2A; Circuits: 1; Device: BLM18PG121SN1D; Supplier Part: C14709; Manufacturer Part: BLM18PG121SN1D; Supplier Footprint: 0603; Datasheet: https://atta.szlcsc.com/upload/public/pdf/source/20130704/1457706621422.pdf; Supplier: LCSC; Convert to PCB: yes
LED1 LED2 LED_h1-LED_h3 = NCD0603G1: Symbol: FC-D1608UGK-520D10; Add into BOM: yes; Forward Voltage (VF): 2.6V~3.6V; Power Dissipation: 72mW; Forward Current: 10mA; Dominant Wavelength: 515nm~530nm; Luminous Intensity: 330mcd~900mcd; Device: NCD0603G1; LCSC Part Name: NCD0603G1; Supplier Part: C84267; Manufacturer Part: NCD0603G1; Supplier Footprint: 0603; Datasheet: https://atta.szlcsc.com/upload/public/pdf/source/20200820/C84267_04BA7703640BAC111D09F5EFB971FBF3.pdf; Supplier: LCSC; Convert to PCB: yes
Q2 Q4 Q5 = DOZ30N10: Add into BOM: yes; Drain to Source Voltage: 100V; Current - Continuous Drain(Id): 30A; Pd - Power Dissipation: 65W; Gate Threshold Voltage (Vgs(th)): 2.5V; Gate Charge(Qg): 13nC@10V; Input Capacitance(Ciss): 918pF@25V; Reverse Transfer Capacitance (Crss@Vds): 29pF@25V; Output Capacitance(Coss): 517pF; Symbol: DOZ30N10; Device: DOZ30N10; Supplier Part: C47018566; Manufacturer Part: DOZ30N10; Supplier Footprint: DFN3x3-8; Datasheet: https://item.szlcsc.com/datasheet/DOZ30N10/49200332.html; Supplier: LCSC; Convert to PCB: yes
R1 R23 R24 R59 = 0603WAF2001T5E: Add into BOM: yes; Power(Watts): 100mW; Overload Voltage (Max): 75V; Symbol: 0603WAF2001T5E; Device: 0603WAF2001T5E; Supplier Part: C22975; Manufacturer Part: 0603WAF2001T5E; Supplier Footprint: 0603; Datasheet: https://atta.szlcsc.com/upload/public/pdf/source/20200306/C422600_1E6D84923E4A46A82E41ADD87F860B5C.pdf; Supplier: LCSC; Convert to PCB: yes
R2 = 0603WAF1001T5E: Add into BOM: yes; Power(Watts): 100mW; Overload Voltage (Max): 75V; Symbol: 0603WAF1001T5E; Device: 0603WAF1001T5E; Supplier Part: C21190; Manufacturer Part: 0603WAF1001T5E; Supplier Footprint: 0603; JLCPCB Part Class: Basic Part; Datasheet: https://atta.szlcsc.com/upload/public/pdf/source/20200306/C422600_1E6D84923E4A46A82E41ADD87F860B5C.pdf; Supplier: LCSC; Convert to PCB: yes
R3 = 0603WAF2403T5E: Add into BOM: yes; Power(Watts): 100mW; Overload Voltage (Max): 75V; Symbol: 0603WAF2403T5E; Device: 0603WAF2403T5E; Supplier Part: C4197; Manufacturer Part: 0603WAF2403T5E; Supplier Footprint: 0603; Datasheet: https://atta.szlcsc.com/upload/public/pdf/source/20200306/C422600_1E6D84923E4A46A82E41ADD87F860B5C.pdf; Supplier: LCSC; Convert to PCB: yes
R4 R14 R16 R32 R33 = 0603WAF6201T5E: Add into BOM: yes; Power(Watts): 100mW; Overload Voltage (Max): 75V; Symbol: 0603WAF6201T5E; Device: 0603WAF6201T5E; Supplier Part: C4260; Manufacturer Part: 0603WAF6201T5E; Supplier Footprint: 0603; Datasheet: https://atta.szlcsc.com/upload/public/pdf/source/20200306/C422600_1E6D84923E4A46A82E41ADD87F860B5C.pdf; Supplier: LCSC; Convert to PCB: yes
R5 R13 R15 R48 = RT0603BRD07100KL: Add into BOM: yes; Power(Watts): 100mW; Overload Voltage (Max): 75V; Symbol: RT0603BRD07100KL; Device: RT0603BRD07100KL; Supplier Part: C122538; Manufacturer Part: RT0603BRD07100KL; Supplier Footprint: 0603; Datasheet: https://atta.szlcsc.com/upload/public/pdf/source/20170721/C122538_1500619326323834092.pdf; Supplier: LCSC; Convert to PCB: yes
R6 = FRC0603F1103TS: Add into BOM: yes; Power(Watts): 100mW; Overload Voltage (Max): 75V; Symbol: FRC0603F1103TS; Device: FRC0603F1103TS; Supplier Part: C2906984; Manufacturer Part: FRC0603F1103TS; Supplier Footprint: 0603; Datasheet: https://atta.szlcsc.com/upload/public/pdf/source/20211221/925EC7D7225764EE0046F22065062C87.pdf; Supplier: LCSC; Convert to PCB: yes
R7 = FRC0603F1502TS: Add into BOM: yes; Power(Watts): 100mW; Overload Voltage (Max): 75V; Symbol: FRC0603F1502TS; Device: FRC0603F1502TS; Supplier Part: C2906995; Manufacturer Part: FRC0603F1502TS; Supplier Footprint: 0603; JLCPCB Part Class: Extended Part; Datasheet: https://atta.szlcsc.com/upload/public/pdf/source/20211221/925EC7D7225764EE0046F22065062C87.pdf; Supplier: LCSC; Convert to PCB: yes
R8 R21 R22 R27 R44 R50 R61 R69-R74 = 0603WAF1002T5E: Add into BOM: yes; Power(Watts): 100mW; Overload Voltage (Max): 75V; Symbol: 0603WAF1002T5E; Device: 0603WAF1002T5E; Supplier Part: C25804; Manufacturer Part: 0603WAF1002T5E; Supplier Footprint: 0603; Datasheet: https://atta.szlcsc.com/upload/public/pdf/source/20200306/C422600_1E6D84923E4A46A82E41ADD87F860B5C.pdf; Supplier: LCSC; Convert to PCB: yes
R9 R10 = 0603WAF5100T5E: Add into BOM: yes; Power(Watts): 100mW; Overload Voltage (Max): 75V; Symbol: 0603WAF5100T5E; Device: 0603WAF5100T5E; Supplier Part: C23193; Manufacturer Part: 0603WAF5100T5E; Supplier Footprint: 0603; Datasheet: https://atta.szlcsc.com/upload/public/pdf/source/20200306/C422600_1E6D84923E4A46A82E41ADD87F860B5C.pdf; Supplier: LCSC; Convert to PCB: yes
R11 = 0603WAF1004T5E: Add into BOM: yes; Power(Watts): 100mW; Overload Voltage (Max): 75V; Symbol: 0603WAF1004T5E; Device: 0603WAF1004T5E; Supplier Part: C22935; Manufacturer Part: 0603WAF1004T5E; Supplier Footprint: 0603; Datasheet: https://atta.szlcsc.com/upload/public/pdf/source/20200306/C422600_1E6D84923E4A46A82E41ADD87F860B5C.pdf; Supplier: LCSC; Convert to PCB: yes
R12 R17 R18 R25 R26 R36-R39 R56 R57 R60 = 0603WAF470JT5E: Add into BOM: yes; Power(Watts): 100mW; Voltage-Supply(Max): 75V; Symbol: 0603WAF470JT5E; Device: 0603WAF470JT5E; Supplier Part: C23182; Manufacturer Part: 0603WAF470JT5E; Supplier Footprint: 0603; Datasheet: https://item.szlcsc.com/datasheet/0603WAF470JT5E/23909.html; Supplier: LCSC; Convert to PCB: yes
R19 R20 R62 = FRC0603J331 TS: Add into BOM: yes; Power(Watts): 100mW; Voltage-Supply(Max): 75V; Symbol: FRC0603J331 TS; Device: FRC0603J331 TS; Supplier Part: C2907152; Manufacturer Part: FRC0603J331 TS; Supplier Footprint: 0603; Datasheet: https://item.szlcsc.com/datasheet/FRC0603J331%2520TS/3180665.html; Supplier: LCSC; Convert to PCB: yes
R29 = RLP25FEER400: Add into BOM: yes; Power(Watts): 2W; Symbol: RLP25FEER400; Device: RLP25FEER400; Supplier Part: C459676; Manufacturer Part: RLP25FEER400; Supplier Footprint: 2512; Datasheet: https://atta.szlcsc.com/upload/public/pdf/source/20191209/C467441_D59F70B0A5C6980F35DB1CB3CCA97CC4.pdf; Supplier: LCSC; Convert to PCB: yes
R30 R31 R42 R43 R51 R52 = 0603WAF100JT5E: Add into BOM: yes; Power(Watts): 100mW; Overload Voltage (Max): 75V; Symbol: 0603WAF100JT5E; Device: 0603WAF100JT5E; Supplier Part: C22859; Manufacturer Part: 0603WAF100JT5E; Supplier Footprint: 0603; Datasheet: https://atta.szlcsc.com/upload/public/pdf/source/20200306/C422600_1E6D84923E4A46A82E41ADD87F860B5C.pdf; Supplier: LCSC; Convert to PCB: yes
R34 R35 = 0603WAF4701T5E: Add into BOM: yes; Power(Watts): 100mW; Overload Voltage (Max): 75V; Symbol: 0603WAF4701T5E; Device: 0603WAF4701T5E; Supplier Part: C23162; Manufacturer Part: 0603WAF4701T5E; Supplier Footprint: 0603; Datasheet: https://atta.szlcsc.com/upload/public/pdf/source/20200306/C422600_1E6D84923E4A46A82E41ADD87F860B5C.pdf; Supplier: LCSC; Convert to PCB: yes
R46 R53 = FRM252WFR100TN: Add into BOM: yes; Power(Watts): 2W; Symbol: FRM252WFR100TN; Device: FRM252WFR100TN; Supplier Part: C7420048; Manufacturer Part: FRM252WFR100TN; Supplier Footprint: 2512; Datasheet: https://atta.szlcsc.com/upload/public/pdf/source/20240709/7FCE84187288C94C67B1004F90EDDF14.pdf; Supplier: LCSC; Convert to PCB: yes
SW1 = SKRPACE010: Add into BOM: yes; Switch Length: 4.2mm; Switch Width: 3.2mm; Switch Height: 2.5mm; Contact Current: 50mA; Voltage Rating (DC): 16V; Symbol: SKRPACE010; Device: SKRPACE010; Supplier Part: C139797; Manufacturer Part: SKRPACE010; Supplier Footprint: SMD; Datasheet: https://atta.szlcsc.com/upload/public/pdf/source/20171113/C139797_15105612676371115729.pdf; Supplier: LCSC; Convert to PCB: yes; With Lamp: -; Mechanical Life: -
U1 = 1812L300/24GR: Add into BOM: yes; Operating Voltage (Max): 24V; Current Rating (Max): 40A; Hold Current: 3A; Trip Current: 5A; Power Dissipation: 1.4W; Maximum Time to Trip: 4s; Symbol: 1812L300/24GR; Device: 1812L300/24GR; LCSC Part Name: 1812L300/24GR; Supplier Part: C20627123; Manufacturer Part: 1812L300/24GR; Supplier Footprint: 1812; Datasheet: https://atta.szlcsc.com/upload/public/pdf/source/20240229/289BC9D14A0E804C9E14D6209DA64A38.pdf; Supplier: LCSC; Convert to PCB: yes
U2 = LGS6302EP: Add into BOM: yes; Input Voltage: 3V~60V; Output Current (Max): 500mA; Switching Frequency: 1.2MHz; Number of Outputs: 1; Quiescent Current (Iq): 180uA; Symbol: LGS6302EP; Device: LGS6302EP; LCSC Part Name: LGS6302EP; Supplier Part: C5280693; Manufacturer Part: LGS6302EP; Supplier Footprint: ESOP-8; Datasheet: https://atta.szlcsc.com/upload/public/pdf/source/20230407/33935B634A1788593A164AA02F3B3E91.pdf; Supplier: LCSC; Convert to PCB: yes; Output Voltage: 3V~60V
U3 = MT2492: Add into BOM: yes; Voltage - Supply: 4.5V~16V; Output Current: 2A; Frequency - Switching: 600kHz; Number of Outputs: 1; Symbol: MT2492; Device: MT2492; Supplier Part: C89358; Manufacturer Part: MT2492; Supplier Footprint: SOT-23-6; Datasheet: https://atta.szlcsc.com/upload/public/pdf/source/20221209/5C81DA9662873D3A116170FFBF63E49D.pdf; Supplier: LCSC; Convert to PCB: yes; Output Type: -; Output Voltage: -; Quiescent Current: -
U6 = STM32F103C8T6: Add into BOM: yes; CPU Core: ARM-M3; CPU Maximum Speed: 72MHz; Program Storage Size: 64KB; Program Memory Type: FLASH; GPIO Ports Number: 37; ADC (Bit): 12bit; Low Voltage Detection Threshold: 2V~3.6V; Symbol: STM32F103C8T6; Device: STM32F103C8T6; Supplier Part: C8734; Manufacturer Part: STM32F103C8T6; Supplier Footprint: LQFP-48(7x7); Datasheet: https://atta.szlcsc.com/upload/public/pdf/source/20220812/8363ACEC51AD55ECEB84799464F7CB85.pdf; Supplier: LCSC; Convert to PCB: yes; Application Area: -
U8 = ADS1220IPWR: Add into BOM: yes; Sampling Rate: 2kHz; number of channels: 2; Voltage - Supply: 2.3V~5.5V; Interface: SPI; Integral non - linearity: 6LSB; Symbol: ADS1220IPWR; Device: ADS1220IPWR; Supplier Part: C48263; Manufacturer Part: ADS1220IPWR; Supplier Footprint: TSSOP-16; Datasheet: https://www.ti.com/cn/lit/gpn/ads1220; Supplier: LCSC; Convert to PCB: yes; differential input: -
U10 U11 U16 = INA226AIDGSR: Add into BOM: yes; Vcm - Common Mode Voltage: 300mV~40V; Voltage - Supply: 2.7V~5.5V; Symbol: INA226AIDGSR; Device: INA226AIDGSR; LCSC Part Name: INA226AIDGSR; Supplier Part: C49851; Manufacturer Part: INA226AIDGSR; Supplier Footprint: MSOP-10; Datasheet: https://atta.szlcsc.com/upload/public/pdf/source/20231204/F50A9EB86BE78FEA83E070C913617774.pdf; Supplier: LCSC; Convert to PCB: yes; Number of Channels: -; Gain: -; Bandwidth: -; Ib - Input Bias Current: -; Vos - Input Offset Voltage: -; Current - Supply: -
U12 = CJ6109B33M: Add into BOM: yes; Voltage - Supply: 6V; Output Voltage: 3.3V; Output Current: 1A; Power Supply Rejection Ratio (PSRR): 70dB@(10kHz); Voltage Dropout: 320mV@(1A); standby current: 70uA; Number of Outputs: 1; Symbol: CJ6109B33M; Device: CJ6109B33M; Supplier Part: C17703066; Manufacturer Part: CJ6109B33M; Supplier Footprint: SOT-23-5L; Datasheet: https://item.szlcsc.com/datasheet/CJ6109B33M/18842777.html; Supplier: LCSC; Convert to PCB: yes
U13-U15 = UCC27517DBVR: Add into BOM: yes; Number of Drivers: 1; Current - Output Low(IOL): 4A; Voltage - Supply: 4.5V~18V; Rise Time: 8ns; Fall Time: 7ns; Symbol: UCC27517DBVR; Device: UCC27517DBVR; LCSC Part Name: UCC27517DBVR; Supplier Part: C99395; Manufacturer Part: UCC27517DBVR; Supplier Footprint: SOT-23-5; Datasheet: https://www.ti.com/cn/lit/gpn/ucc27517; Supplier: LCSC; Convert to PCB: yes; Current - Output High(IOH): 4A
X1 = X32258MSB4SI: Add into BOM: yes; Load Capacitance: 20pF; Symbol: X32258MSB4SI; Device: X32258MSB4SI; Supplier Part: C2682774; Manufacturer Part: X32258MSB4SI; Supplier Footprint: SMD3225-4P; Datasheet: https://item.szlcsc.com/datasheet/X32258MSB4SI/2777871.html; Supplier: LCSC; Convert to PCB: yes; Value: 8MHz

## Sheet Connect.SchDoc
size A4
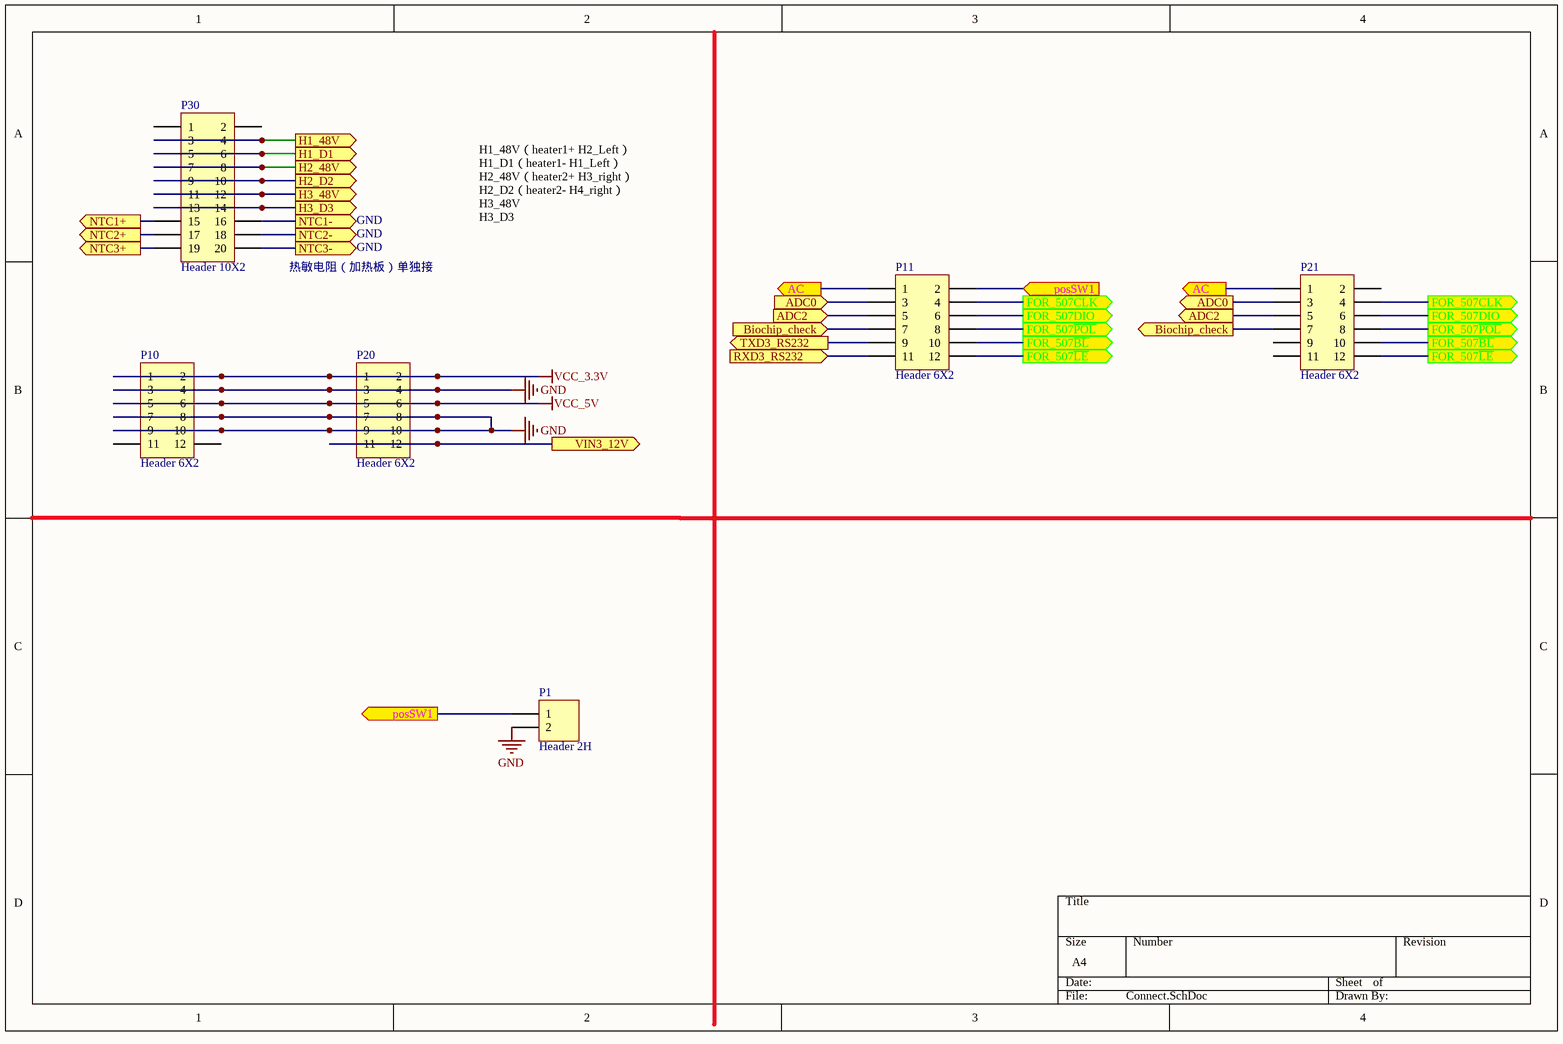
[diagram p6: Connect.SchDoc]

### Parts
P1  Header 2H  [CONN-TH_2P-P2.54_ZX-XH2.54-2PZZ-Y]
P10  Header 6X2  [HDR-6X2]
P11  Header 6X2  [HDR-6X2]
P20  Header 6X2  [HDR-6X2]
P21  Header 6X2  [HDR-6X2]
P30  Header 10X2  [HDR-10X2]

### Ports
AC (out), ADC0 (in), ADC0 (out), ADC2 (in), ADC2 (out), Biochip_check (in), Biochip_check (out), FOR_507CLK (out), FOR_507DIO (out), FOR_507~{BL} (out), FOR_507~{LE} (out), FOR_507~{POL} (out), H1_48V (out), H1_D1 (out), H2_48V (out), H2_D2 (out), H3_48V (out), H3_D3 (out), NTC1+ (out), NTC1- (out), NTC2+ (out), NTC2- (out), NTC3+ (out), NTC3- (out), posSW1 (in), posSW1 (out), RXD3_RS232 (in), TXD3_RS232 (out), VIN3_12V (out)

### Nets
+48V: P30.3 P30.4 P30.7 P30.8 P30.11 P30.12 ; port H3_48V, port H2_48V, port H1_48V
GND: P1.2 P10.3 P10.4 P10.7 P10.8 P10.9 P10.10 P20.3 P20.4 P20.7 P20.8 P20.9 P20.10 P30.16 P30.18 P30.20 ; port NTC1-, port NTC2-, port NTC3-
VCC_3.3V: P10.1 P10.2 P20.1 P20.2
VCC_5V: P10.5 P10.6 P20.5 P20.6
D1: P30.5 P30.6 ; port H1_D1
D2: P30.9 P30.10 ; port H2_D2
D3: P30.13 P30.14 ; port H3_D3
NTC1: P30.15 ; port NTC1+
NTC2: P30.17 ; port NTC2+
NTC3: P30.19 ; port NTC3+
NetP1_1: P1.1 P11.2 ; port posSW1
NetP11_1: P11.1 P21.1 ; port AC
NetP11_3: P11.3 P21.3 ; port ADC0
NetP11_4: P11.4 P21.4 ; port FOR_507CLK
NetP11_5: P11.5 P21.5 ; port ADC2
NetP11_6: P11.6 P21.6 ; port FOR_507DIO
NetP11_7: P11.7 P21.7 ; port Biochip_check
NetP11_8: P11.8 P21.8 ; port FOR_507~{POL}
NetP11_9: P11.9 ; port TXD3_RS232
NetP11_10: P11.10 P21.10 ; port FOR_507~{BL}
NetP11_11: P11.11 ; port RXD3_RS232
NetP11_12: P11.12 P21.12 ; port FOR_507~{LE}
NetP20_11: P20.11 P20.12 ; port VIN3_12V

Not connected (* = marked no-connect by the designer): P10 11 12; P21 2 9 11; P30 1 2

### Notes on the sheet
- GND
- H1_48V（heater1+ H2_Left）
  H1_D1（heater1- H1_Left）
  H2_48V（heater2+ H3_right）
  H2_D2（heater2- H4_right）
  H3_48V
  H3_D3
- 热敏电阻（加热板）单独接

### Library data of the parts
P1 = Header 2H: Header, 2-Pin, Right Angle; LatestRevisionDate: 17-Jul-2002; LatestRevisionNote: Re-released for DXP Platform.; Publisher: Altium Limited
P10 P11 P20 P21 = Header 6X2: Header, 6-Pin, Dual row; LatestRevisionDate: 17-Jul-2002; LatestRevisionNote: Re-released for DXP Platform.; Publisher: Altium Limited
P30 = Header 10X2: Header, 10-Pin, Dual row; LatestRevisionDate: 17-Jul-2002; LatestRevisionNote: Re-released for DXP Platform.; Publisher: Altium Limited

## Nets that join several sheets
+48V: heater_V1 (14 pins), Connect (6 pins)
GND: heater_V1 (102 pins), Connect (16 pins)
D1: heater_V1 (Q2.5 Q2.6 Q2.7 Q2.8), Connect (P30.5 P30.6)
D2: heater_V1 (Q4.5 Q4.6 Q4.7 Q4.8), Connect (P30.9 P30.10)
D3: heater_V1 (Q5.5 Q5.6 Q5.7 Q5.8), Connect (P30.13 P30.14)
NetP11_9: heater_V1 (R32.1), Connect (P11.9)
NetP11_11: heater_V1 (R33.1), Connect (P11.11)
NetP20_11: heater_V1 (U1.1), Connect (P20.11 P20.12)
NTC1: heater_V1 (R15.1 U8.11), Connect (P30.15)
NTC2: heater_V1 (R13.1 U8.7), Connect (P30.17)
NTC3: heater_V1 (R48.1 U8.10), Connect (P30.19)